# Altium schematic sheet baidoxe.SchDoc
size A3; SheetNumber: 1; SheetTotal: 1
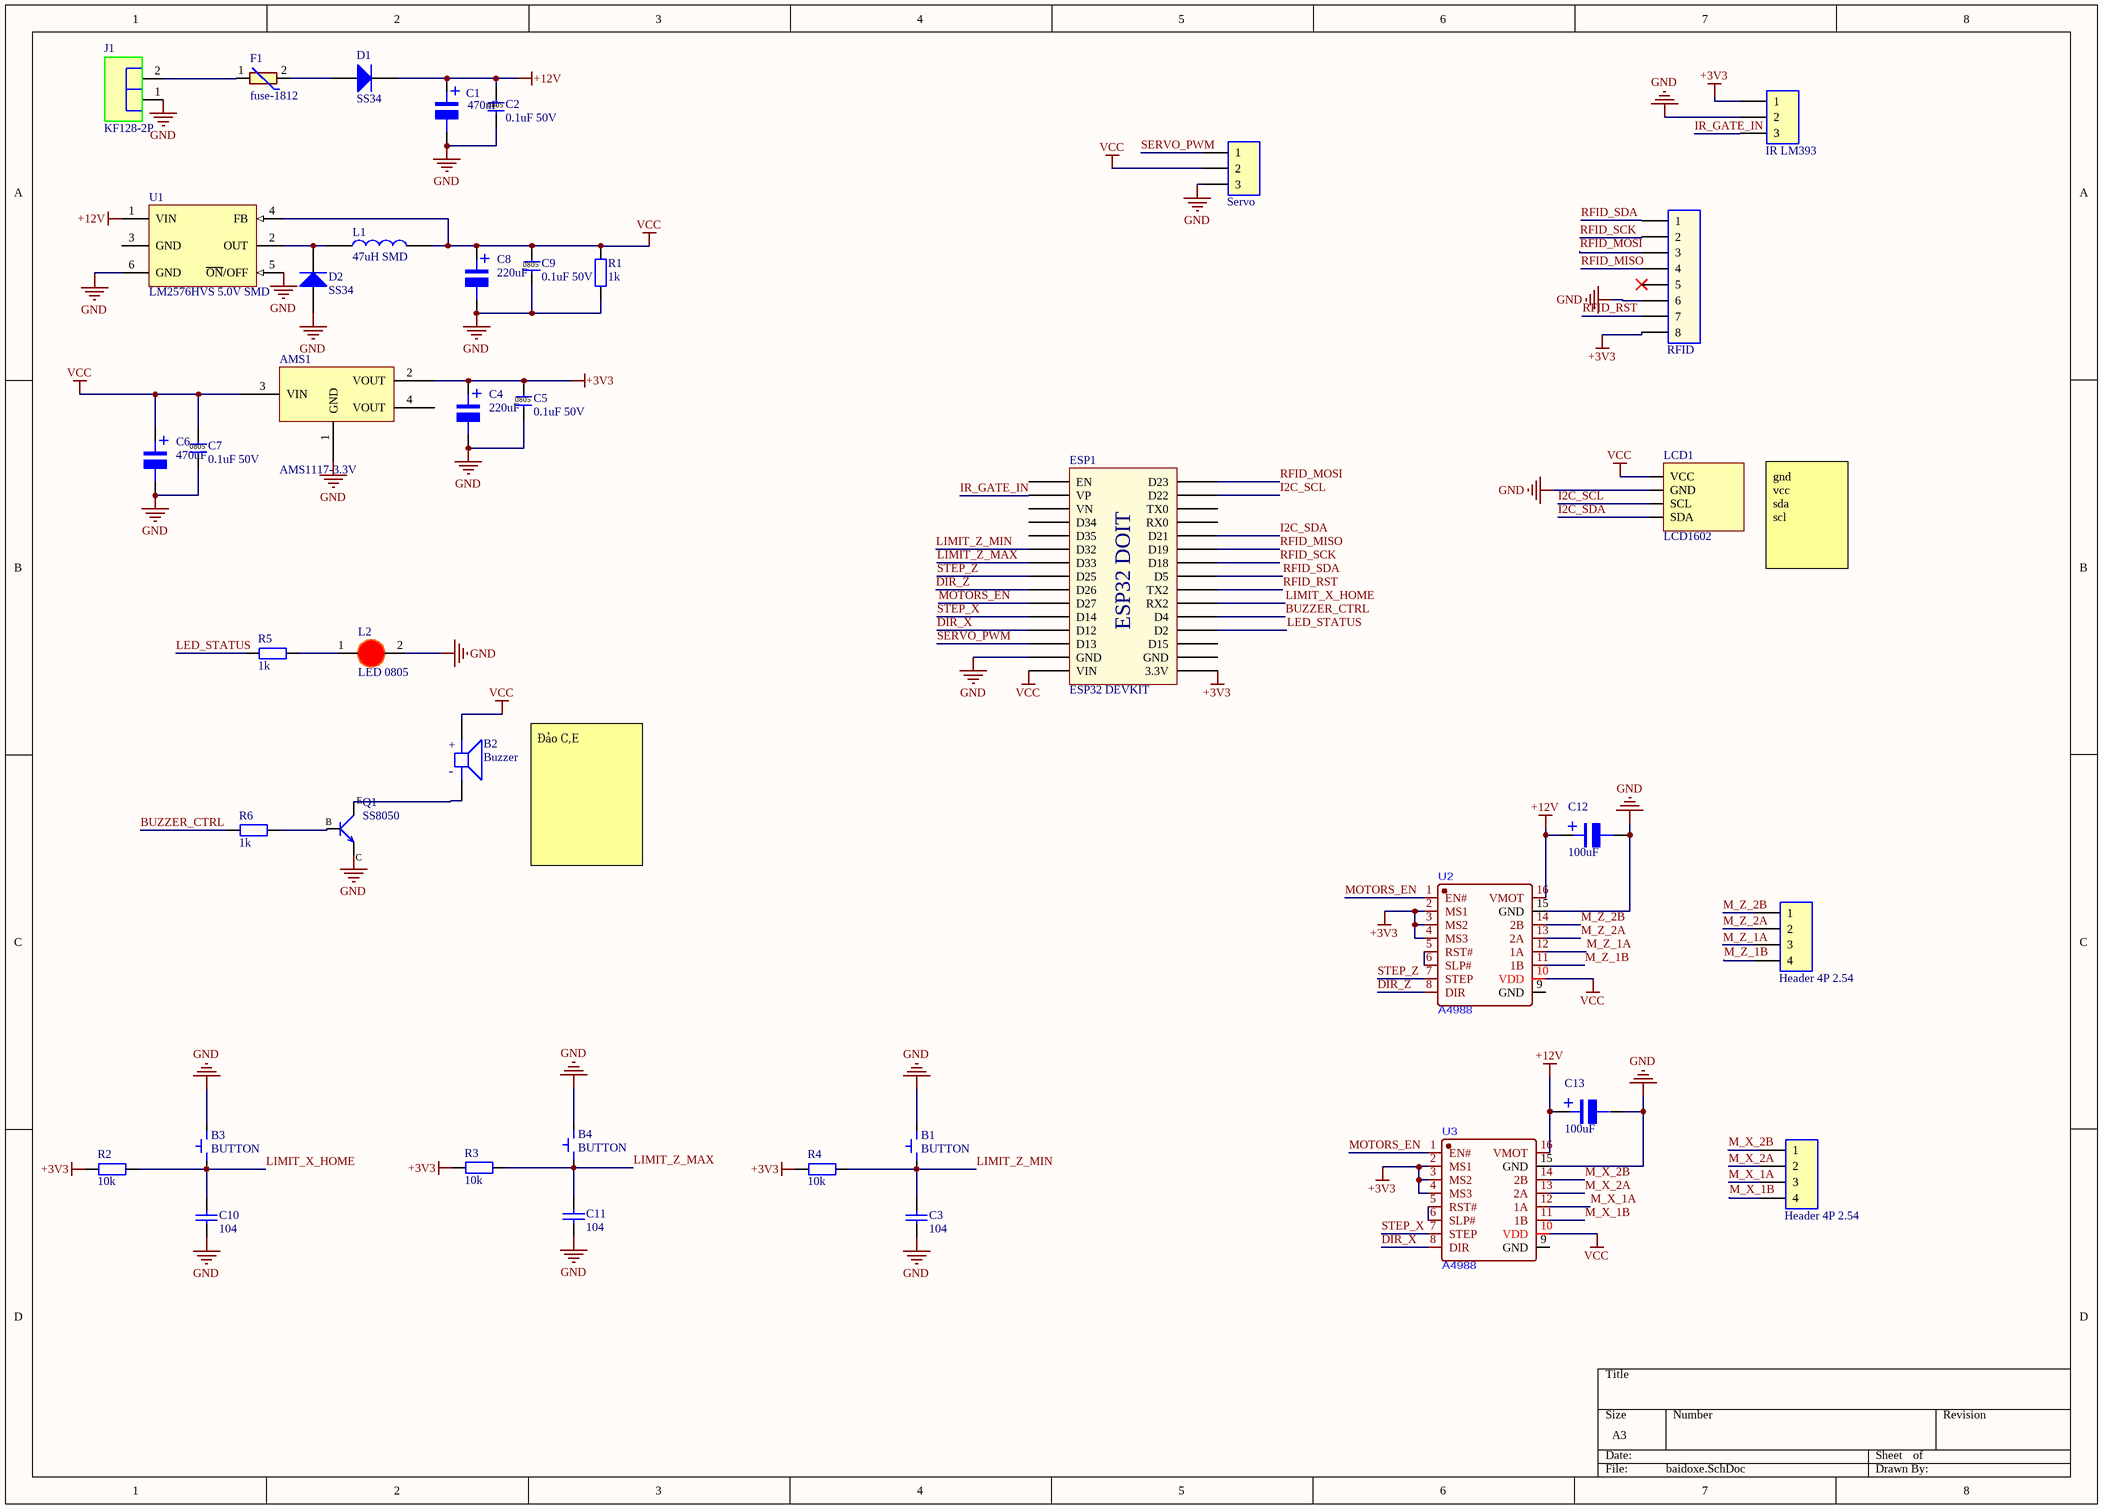
[diagram p0: baidoxe.SchDoc]

## Parts
AMS1  AMS1117-3.3V  [SOT223]
B1  BUTTON  [SW_PTS_647_SN50_SMTR2_LFS]
B2  Buzzer  [BUZZER,5V,9mm]
B3  BUTTON  [SW_PTS_647_SN50_SMTR2_LFS]
B4  BUTTON  [SW_PTS_647_SN50_SMTR2_LFS]
C1  470uF  [tu nhom 8 (f)]
C2  0.1uF 50V  [CAP_SMD_0805_CERAMIC]
C3  104  [tu 0805]
C4  220uF  [tu nhom 8 (f)]
C5  0.1uF 50V  [CAP_SMD_0805_CERAMIC]
C6  470uF  [tu nhom 8 (f)]
C7  0.1uF 50V  [CAP_SMD_0805_CERAMIC]
C8  220uF  [tu nhom 8 (f)]
C9  0.1uF 50V  [CAP_SMD_0805_CERAMIC]
C10  104  [tu 0805]
C11  104  [tu 0805]
C12  100uF  [tu nhom 6.3 (d)]
C13  100uF  [tu nhom 6.3 (d)]
D1  SS34  [DIODE SMA]
D2  SS34  [DIODE SMA]
ESP1  ESP32 DEVKIT  [ESP32 WROOM 32 KIT]
F1  fuse-1812  [FUSSC324X455X250-2N]
H1  Header 4P 2.54  [XH2.54M-4]
H2  Header 4P 2.54  [XH2.54M-4]
H3  IR LM393  [XH2.54M-3]
H4  RFID  [XH2.54M-8]
H5  Servo  [XH2.54M-3]
J1  KF128-2P  [KF128-3.81-2P]
L1  47uH SMD  [Cuon Cam 7x7x5]
L2  LED 0805  [LED-0805-Red]
LCD1  LCD1602  [LCD1602+i2c]
Q1  SS8050  [MOS-FET; SOT23]
R1  1k  [tro smd 0805]
R2  10k  [tro smd 0805]
R3  10k  [tro smd 0805]
R4  10k  [tro smd 0805]
R5  1k  [tro smd 0805]
R6  1k  [tro smd 0805]
U1  LM2576HVS 5.0V SMD  [TO263-5]
U2  A4988  [A4988]
U3  A4988  [A4988]

## Nets
+3V3: AMS1.2(VOUT) C4.1 C5.1 ESP1.16(3.3V) H3.1 H4.8 R2.1 R3.1 R4.1 U2.2(MS1) U2.3(MS2) U2.4(MS3) U3.2(MS1) U3.3(MS2) U3.4(MS3)
+12V: C1.1 C2.1 C12.1 C13.1 D1.2(K) U1.1(VIN) U2.16(VMOT) U3.16(VMOT)
GND: AMS1.1(GND) B1.2 B3.2 B4.2 C1.2 C2.2 C3.2 C4.2 C5.2 C6.2 C7.2 C8.2 C9.2 C10.2 C11.2 C12.2 C13.2 D2.1(A) ESP1.14(GND) H3.2 H4.6 H5.3 J1.1 L2.2(K) LCD1.2(GND) Q1.3 R1.1 U1.5(~{ON}/OFF) U1.6(GND) U2.15(GND) U3.15(GND)
VCC: AMS1.3(VIN) B2.1 C6.1 C7.1 C8.1 C9.1 ESP1.15(VIN) H5.2 L1.2 LCD1.1(VCC) R1.2 U1.4(FB) U2.10(VDD) U3.10(VDD)
BUZZER_CTRL: ESP1.20(D4) R6.1
DIR_X: ESP1.12(D12) U3.8(DIR)
DIR_Z: ESP1.9(D26) U2.8(DIR)
I2C_SCL: ESP1.29(D22) LCD1.3(SCL)
I2C_SDA: ESP1.26(D21) LCD1.4(SDA)
IR_GATE_IN: ESP1.2(VP) H3.3
LED_STATUS: ESP1.19(D2) R5.1
LIMIT_X_HOME: B3.1 C10.1 ESP1.21(RX2) R2.2
LIMIT_Z_MAX: B4.1 C11.1 ESP1.7(D33) R3.2
LIMIT_Z_MIN: B1.1 C3.1 ESP1.6(D32) R4.2
M_X_1A: H2.3 U3.12(1A)
M_X_1B: H2.4 U3.11(1B)
M_X_2A: H2.2 U3.13(2A)
M_X_2B: H2.1 U3.14(2B)
M_Z_1A: H1.3 U2.12(1A)
M_Z_1B: H1.4 U2.11(1B)
M_Z_2A: H1.2 U2.13(2A)
M_Z_2B: H1.1 U2.14(2B)
MOTORS_EN: ESP1.10(D27) U2.1(EN#) U3.1(EN#)
RFID_MISO: ESP1.25(D19) H4.4
RFID_MOSI: ESP1.30(D23) H4.3
RFID_RST: ESP1.22(TX2) H4.7
RFID_SCK: ESP1.24(D18) H4.2
RFID_SDA: ESP1.23(D5) H4.1
SERVO_PWM: ESP1.13(D13) H5.1
STEP_X: ESP1.11(D14) U3.7(STEP)
STEP_Z: ESP1.8(D25) U2.7(STEP)
NetB2_2: B2.2 Q1.2
NetD1_1: D1.1(A) F1.2
NetD2_2: D2.2(K) L1.1 U1.2(OUT)
NetF1_1: F1.1 J1.2
NetL2_1: L2.1(A) R5.2
NetQ1_1: Q1.1 R6.2
NetU2_5: U2.5(RST#) U2.6(SLP#)
NetU3_5: U3.5(RST#) U3.6(SLP#)

Not connected (* = marked no-connect by the designer): AMS1 4(VOUT); ESP1 1(EN) 3(VN) 4(D34) 5(D35) 17(GND) 18(D15) 27(RX0) 28(TX0); H4 5*; U1 3(GND); U2 9(GND); U3 9(GND)

## Notes on the sheet
- gnd
  vcc
  sda
  scl
- Đảo C,E
- (in symbol BUZZER, 5V, 9mmm) +; -
- (in symbol ESP32 WROOM 32 KIT_1) ESP32 DOIT
- (in symbol TRANSISTOR_SS8050) E; B; C
- (in symbol Tu Nhom 100uF 16V) +
- (in symbol Tu Nhom 470uF 16V) +

## Library data of the parts
AMS1 = AMS1117 SMD: Dán; Value: AMS1117-3.3V SOT223; Don_Vi: Con; Ma_Hang: MH000596; Ghi_Chu: *; Kieu_Chan: *; Chung_Loai: Dán
B1 B3 B4 = BUTTON_SMD, 0.05A, 12V: Switch Tactile N.O. SPST Round Button Gull Wing 0.05A 12VDC 100000Cycles 1.77N SMD T/R; Manufacturer: C&K Components; Manufacturer Part Number: PTS647SM50SMTR2LFS; Contact Resistance: 100mΩ; Electrical Life: 100kcycles; Max Current Rating: 50mA; Max Voltage Rating (DC): 12V; Number of Positions: 1; Operating Force: 2.26N; MADE BY: HOANGBEU; Supplier: DigiKey; Supplier Part Number: 108-PTS647SM50SMTR2LFSCT-ND; RoHS: Compliant; Category: Tactile Switches; Stock: 16284; Pricing: 1=0.3, 10=0.257, 25=0.24, 100=0.2151, 250=0.19936, 500=0.18812 (USD); Export Control Classification Number (ECCN) Code: EAR99; Height: 2.9mm; Harmonized Tariff Schedule (HTS) Code: 8536.50.90.40; Insulation Resistance: 100MΩ; Introduction Date: 2019-06-11; Length: 4.5mm; Lifecycle Status: Production; Max Operating Temperature: 70°C; Min Operating Temperature: -40°C; REACH SVHC: Yes; Schedule B: 8536509065, 8536509065|8536509065, 8536509065|8536509065|8536509065, 8536509065|8536509065|8536509065|8536509065; Termination: Solder; Throw Configuration: SPST; ComponentLink1URL: https://datasheet.octopart.com:443/PTS647SM50SMTR2LFS-C%26K-Components-datasheet-180017464.pdf?src-supplier=IHS; ComponentLink1Description: https://datasheet.octopart.com:443/PTS647SM50SMTR2LFS-C%26K-Components-datasheet-180017464.pdf?src-supplier=IHS; ComponentLink2URL: https://datasheet.octopart.com:443/PTS647SM50SMTR2LFS-C%26K-Components-datasheet-117317067.pdf?src-supplier=Future+Electronics; ComponentLink2Description: https://datasheet.octopart.com:443/PTS647SM50SMTR2LFS-C%26K-Components-datasheet-117317067.pdf?src-supplier=Future+Electronics; ComponentLink3URL: https://datasheet.octopart.com:443/PTS647SM50SMTR2LFS-C%26K-Components-datasheet-145017121.pdf?src-supplier=Electro+Sonic; ComponentLink3Description: https://datasheet.octopart.com:443/PTS647SM50SMTR2LFS-C%26K-Components-datasheet-145017121.pdf?src-supplier=Electro+Sonic; ComponentLink4URL: https://datasheet.octopart.com:443/PTS-647-SM50-SMTR2-LFS-C%26K-Components-datasheet-119449707.pdf?src-supplier=RS+(Formerly+Allied+Electronics); ComponentLink4Description: https://datasheet.octopart.com:443/PTS-647-SM50-SMTR2-LFS-C%26K-Components-datasheet-119449707.pdf?src-supplier=RS+(Formerly+Allied+Electronics); ComponentLink5Description: LINK SP; ComponentLink5URL: https://www.digikey.vn/en/products/detail/c-k/PTS647SM50SMTR2-LFS/9649858; ComponentLink6Description: MADE BY; ComponentLink6URL: HOANGBEU; LINK SP: https://www.digikey.vn/en/products/detail/c-k/PTS647SM50SMTR2-LFS/9649858; LINK MUA: https://linhkien.cxtvn.com/11090-nut-nhan-smd-4p-45x45x5mm-10c.html
B2 = BUZZER, 5V, 9mmm: Electromagnetic Buzzer; Manufacturer: Soberton; Manufacturer Part Number: GT-0905A; Frequency: 2.73kHz; Operating Supply Current: 80mA; Voltage Rating: 5V; Supplier: DigiKey; Supplier Part Number: 433-1033-ND; RoHS: Compliant; Category: Audio Products; Stock: 37843; Pricing: 1=1.27, 10=0.958, 25=0.8608, 50=0.7954, 100=0.7361, 250=0.66588, 500=0.61822, 1000=0.57471, 5000=0.48747 (USD); Height: 4.5mm; Lead Free: Lead Free; Max Operating Temperature: 60°C; Min Operating Temperature: -20°C; Mounting Technology: Through Hole; Packaging: Tape & Reel (TR); Sensing Method: Magnetic; Termination: PC Pins; ComponentLink1URL: https://datasheet.octopart.com:443/GT-0905A-Soberton-datasheet-189107844.pdf?src-supplier=Master+Electronics; ComponentLink1Description: https://datasheet.octopart.com:443/GT-0905A-Soberton-datasheet-189107844.pdf?src-supplier=Master+Electronics; ComponentLink2Description: LINK MUA; ComponentLink2URL: https://linhkien.cxtvn.com/3372-coi-chip-3512v-tmb09a05-9x5mm.html; ComponentLink3Description: MADE BY; ComponentLink3URL: HOANGBEU
C1 C4 C6 C8 = Tu Nhom 470uF 16V: Dán; Don_Vi: Con; So_Chan: 2; Ten_Linh_Kien: Tụ Nhôm 470uF 16V 8x10.4MM; Ma_Hang: MH001940; Chung_Loai: Dán; Kieu_Chan: *
C2 C5 C7 C9 = CAP_SMD_Cera, 0.1uF, 10%, 50V, 0805: 0.1 (104) µF ±10% 50V Ceramic Capacitor X7R 0805 (2012 Metric); Manufacturer Cross: Yageo; Manufacturer Part Number: CC0805KRX7R9BB104; Capacitance: 100nF; Insulation Resistance: 100GR; LIBRARY MADE BY: MR. XUAN SIEU; Supplier 1: Digikey; RoHS: Yes; Category: Ceramic Capacitors; Stock 1: 3664790; Pricing 1: 1=0.08, 10=0.032, 100=0.026, 1000=0.02, 4000=0.0176, 8000=0.01595, 12000=0.01512, 20000=0.0142, 28000=0.01367, 40000=0.01315, 100000=0.01202, 200000=0.01134, 400000=0.01077 (USD); Mount: Surface Mount; Case/Package: 0805; Number of Pins: 2; Case Code (Metric): 2012; Case Code (Imperial): 0805; Material: Ceramic; Min Operating Temperature: -55°C; Max Operating Temperature: 125°C; Packaging: Tape and Reel; Tolerance: 10%; Voltage Rating: 50V; Package Quantity: 4000; Dielectric: X7R; Termination: SMD/SMT; Voltage: 50V; Series: CC; Length: 2mm; Height: 0.85mm; Depth: 1.25mm; Radiation Hardening: No; Reach SVHC Compliant: No; RoHS Compliant: Yes; Lead Free: 5697LeadFree; Halogen Free: 5694HalogenFree; ComponentLink1URL: https://datasheet.ciiva.com/46393/1734573-46393307.pdf?src-supplier=Element14; ComponentLink1Description: https://datasheet.ciiva.com/46393/1734573-46393307.pdf?src-supplier=Element14; ComponentLink2URL: https://datasheet.ciiva.com/155/mlccorderingcode-155930.pdf?src-supplier=Digikey; ComponentLink2Description: https://datasheet.ciiva.com/155/mlccorderingcode-155930.pdf?src-supplier=Digikey; ComponentLink3URL: https://datasheet.ciiva.com/29242/445210-da-01-en-kerko-chip-0805-x7r-0-1uf-10proz-50vg-29242074.pdf?src-supplier=Conrad; ComponentLink3Description: https://datasheet.ciiva.com/29242/445210-da-01-en-kerko-chip-0805-x7r-0-1uf-10proz-50vg-29242074.pdf?src-supplier=Conrad; ComponentLink4Description: Link Cross; ComponentLink4URL: https://www.lcsc.com/product-detail/Multilayer-Ceramic-Capacitors-MLCC-SMD-SMT_YAGEO-CC0805KRX7R9BB104_C49678.html?s_z=n_CC0805KRX7R9BB104; ComponentLink5Description: Link Viet Nam; ComponentLink5URL: https://linhkien.cxtvn.com/1976-tu-khong-phan-cuc-0805.html; ComponentLink6Description: Link Original; ComponentLink6URL: https://www.digikey.com/en/products/detail/yageo/CC0805KRX7R9BB104/302874; Supplier Part Number 1: 311-1140-1-ND
C3 C10 C11 = Tu 0805 104 50V 10%: Dán; Don_Vi: Con; So_Chan: 2; Ten_Linh_Kien: Tụ 0805 104-100nF 10% 50V; Ma_Hang: MH004551; Chung_Loai: Dán; Kieu_Chan: *
C12 C13 = Tu Nhom 100uF 16V: Dán; Don_Vi: Con; So_Chan: 2; Ten_Linh_Kien: Tụ Nhôm 100uF 16V 6.3x5.4MM; Ma_Hang: MH002219; Chung_Loai: Dán; Kieu_Chan: *
D1 D2 = Diode SS34 ( 1N5822 ): Dán; Don_Vi: Con; Ma_Hang: MH002104; Ten_Linh_Kien: Diode SS34 3A 40V SMA ( 1N5822 SS34A); Kieu_Chan: *; Chung_Loai: Dán
ESP1 = ESP32 WROOM 32 KIT_1: Bảng Mạch Phát Triển WiFi Bluetooth Esp32; Designer: Kata; Datasheet: https://documentation.espressif.com/esp32-wroom-32_datasheet_en.pdf; Link Vietnam: https://shopee.vn/product/578443443/13742226706?d_id=3c2cb&uls_trackid=56tnvmar01un&utm_content=dRt74n3cjNaVUMxz7zAFb97c8p7
F1 = fuse-1812L300: Polymeric PTC Resettable Fuse 24V 3 A Ih Surface Mount 1812 (4532 Metric), Concave; MF: Littelfuse Inc.; MP: 1812L300/24SLER; Check_prices: https://www.snapeda.com/parts/1812L300/24SLER/Littelfuse/view-part/?ref=eda; Availability: In Stock; Price: None; Package: None; Value: *; SnapEDA_Link: https://www.snapeda.com/parts/1812L300/24SLER/Littelfuse/view-part/?ref=snap; Purchase-URL: https://pricing.snapeda.com/search/part/1812L300/24SLER/?ref=eda
H1 H2 = Header 4P 2.54: Cắm Đực Thẳng; Ten_Linh_Kien: Header 4P XH2.54-4P Đực Thẳng; Don_Vi: Con; Ma_Hang: MH001285; Chung_Loai: Cắm
H3 H5 = Header 3P 2.54: Ten_Linh_Kien: Header 3P XH2.54-3P Đực Thẳng; Don_Vi: Con; Ma_Hang: MH001292; Chung_Loai: Cắm
H4 = Header 8P 2.54: Ten_Linh_Kien: Header 8P XH2.54-8P Đực Thẳng; Don_Vi: Con; Ma_Hang: MH003366; Chung_Loai: Cắm
L1 = CUON CAM 47uH SMD: Dán; Don_Vi: Con; Ma_Hang: MH004211; Ten_Linh_Kien: Cuộn Cảm 47uH 7x7x4MM CD74R; Ghi_Chu: *; Kieu_Chan: *; Chung_Loai: Dán
L2 = LED 0805 Do: Dán; Don_Vi: Con; Ma_Hang: MH000897; Ten_Linh_Kien: LED 0805 Màu Đỏ (Red); Ghi_Chu: *; Kieu_Chan: *; Chung_Loai: Dán
LCD1 = LCD1602+i2c: LCD 1602 Xanh Lá; Designer: Kata; Link Vietnam: https://linhkienchatluong.vn/urllcd1602/lcd1602-5v-16x2-xanh-duong_sp2000_ct3888.aspx; Datasheet: https://www.alldatasheet.com/html-pdf/1574132/CRYSTAIFONTZ/LCD-1602A/1009/1/LCD-1602A.html
Q1 = TRANSISTOR_SS8050: TRANS NPN 25V 1.5A SOT23-3 / Bipolar (BJT) Transistor NPN 25 V 1.5 A 100MHz 300 mW Surface Mount SOT-23-3; Manufacturer: Comchip; Manufacturer Part Number: SS8050-G; Collector Base Voltage (VCBO): 40V; Collector Emitter Saturation Voltage: 500mV; Emitter Base Voltage (VEBO): 5V; hFE Min: 40; Max Junction Temperature (Tj): 150°C; Max Power Dissipation: 300mW; Number of Elements: 1; MADE BY: HOANGBEU; Supplier: DigiKey; Supplier Part Number: 641-1790-1-ND; RoHS: Compliant; Category: BJTs; Pricing: 1=0.26, 10=0.157, 100=0.0976, 500=0.0716, 1000=0.06315 (USD); Case/Package: TO-236-3; Collector Emitter Breakdown Voltage: 25V; Collector Emitter Voltage (VCEO): 25V; Height: 1.15mm; Lifecycle Status: Production; Max Breakdown Voltage: 25V; Max Collector Current: 1.5A; Max Operating Temperature: 150°C; Mounting Technology: Surface Mount; Number of Terminals: 3; Power Dissipation: 300mW; REACH SVHC: Yes; Schedule B: 8541100070|8541100070|8541100070|8541100070|8541100070; Transition Frequency: 100MHz; ComponentLink1URL: https://datasheet.octopart.com:443/SS8050-G-Comchip-datasheet-180131983.pdf?src-supplier=IHS; ComponentLink1Description: https://datasheet.octopart.com:443/SS8050-G-Comchip-datasheet-180131983.pdf?src-supplier=IHS; ComponentLink2URL: https://datasheet.octopart.com:443/SS8050-G-Comchip-datasheet-155422643.pdf?src-supplier=Upverter; ComponentLink2Description: https://datasheet.octopart.com:443/SS8050-G-Comchip-datasheet-155422643.pdf?src-supplier=Upverter; ComponentLink3URL: https://datasheet.octopart.com:443/SS8050-G-Comchip-datasheet-189767092.pdf?src-supplier=LCSC; ComponentLink3Description: https://datasheet.octopart.com:443/SS8050-G-Comchip-datasheet-189767092.pdf?src-supplier=LCSC; ComponentLink4Description: LINK SP; ComponentLink4URL: https://www.digikey.com/en/products/detail/evvo/SS8050/21407173; ComponentLink5Description: MADE BY; ComponentLink5URL: HOANGBEU; LINK SP: https://www.digikey.com/en/products/detail/evvo/SS8050/21407173; LINK MUA: https://linhkien.cxtvn.com/6446-mmss8050-l-tp-transistor-npn-25v-15a-sot-23-5c.html
R1 R5 R6 = Tro 0805 1% 1k: Dán; Don_Vi: Con; So_Chan: 2; Ten_Linh_Kien: Trở 0805 1% 1k; Ma_Hang: MH005468; Chung_Loai: Dán; Kieu_Chan: *
R2-R4 = Tro 0805 1% 10k: Dán; Don_Vi: Con; So_Chan: 2; Ten_Linh_Kien: Trở 0805 1% 10k; Ma_Hang: MH005473; Chung_Loai: Dán; Kieu_Chan: *
U1 = LM2576HVS 5.0V SMD: Dán; Ten_Linh_Kien: LM2576HVS-5.0V BUCK 5V 3A TO263-5; Don_Vi: Con; Ma_Hang: MH002362; Ghi_Chu: *; Kieu_Chan: *; Chung_Loai: Dán
U2 U3 = A4988: Designer: Kata; Datasheet: https://www.alldatasheet.com/datasheet-pdf/pdf/455036/ALLEGRO/A4988.html; Link origin: https://grabcad.com/library/a4988-stepper-driver-with-pins-socketed-1, https://easyeda.com/editor#id=!b21f460f337c435d854d954092ca6a03|!253cdfaaa9784aa9ac4f75afb905f3ce; Link Vietnam: https://linhkienchatluong.vn/urlmodule-dieu-khien-dong-co/module-dieu-khien-dong-co-buoc-a4988_sp496_ct6114.aspx